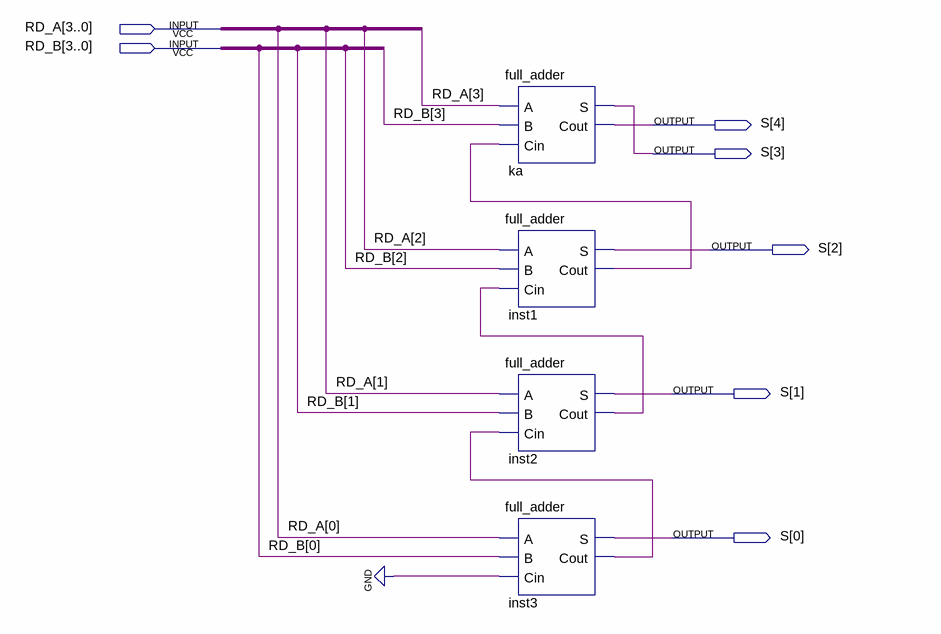
[diagram p0: schematic sheet]
// Quartus schematic full_adder_4bit.bdf as structural Verilog: 4 symbols, 7 pins
module full_adder_4bit (
  input  [3:0] RD_A,
  input  [3:0] RD_B,
  output [4:0] S
);

  wire inst1_cout, inst2_cout, inst3_cout;

  full_adder ka (.A(RD_A[3]), .B(RD_B[3]), .Cin(inst1_cout), .S(S[3]), .Cout(S[4]));
  full_adder inst1 (.A(RD_A[2]), .B(RD_B[2]), .Cin(inst2_cout), .S(S[2]), .Cout(inst1_cout));
  full_adder inst2 (.A(RD_A[1]), .B(RD_B[1]), .Cin(inst3_cout), .S(S[1]), .Cout(inst2_cout));
  full_adder inst3 (.A(RD_A[0]), .B(RD_B[0]), .Cin(1'b0), .S(S[0]), .Cout(inst3_cout));
endmodule
